# Altium schematic sheet FrontEnd.SchDoc
size B; SheetNumber: 3; SheetTotal: 5; SPICEModelCacheLCCOZNWX: <root> / <DocumentId>LCCOZNWX</DocumentId> / </root>
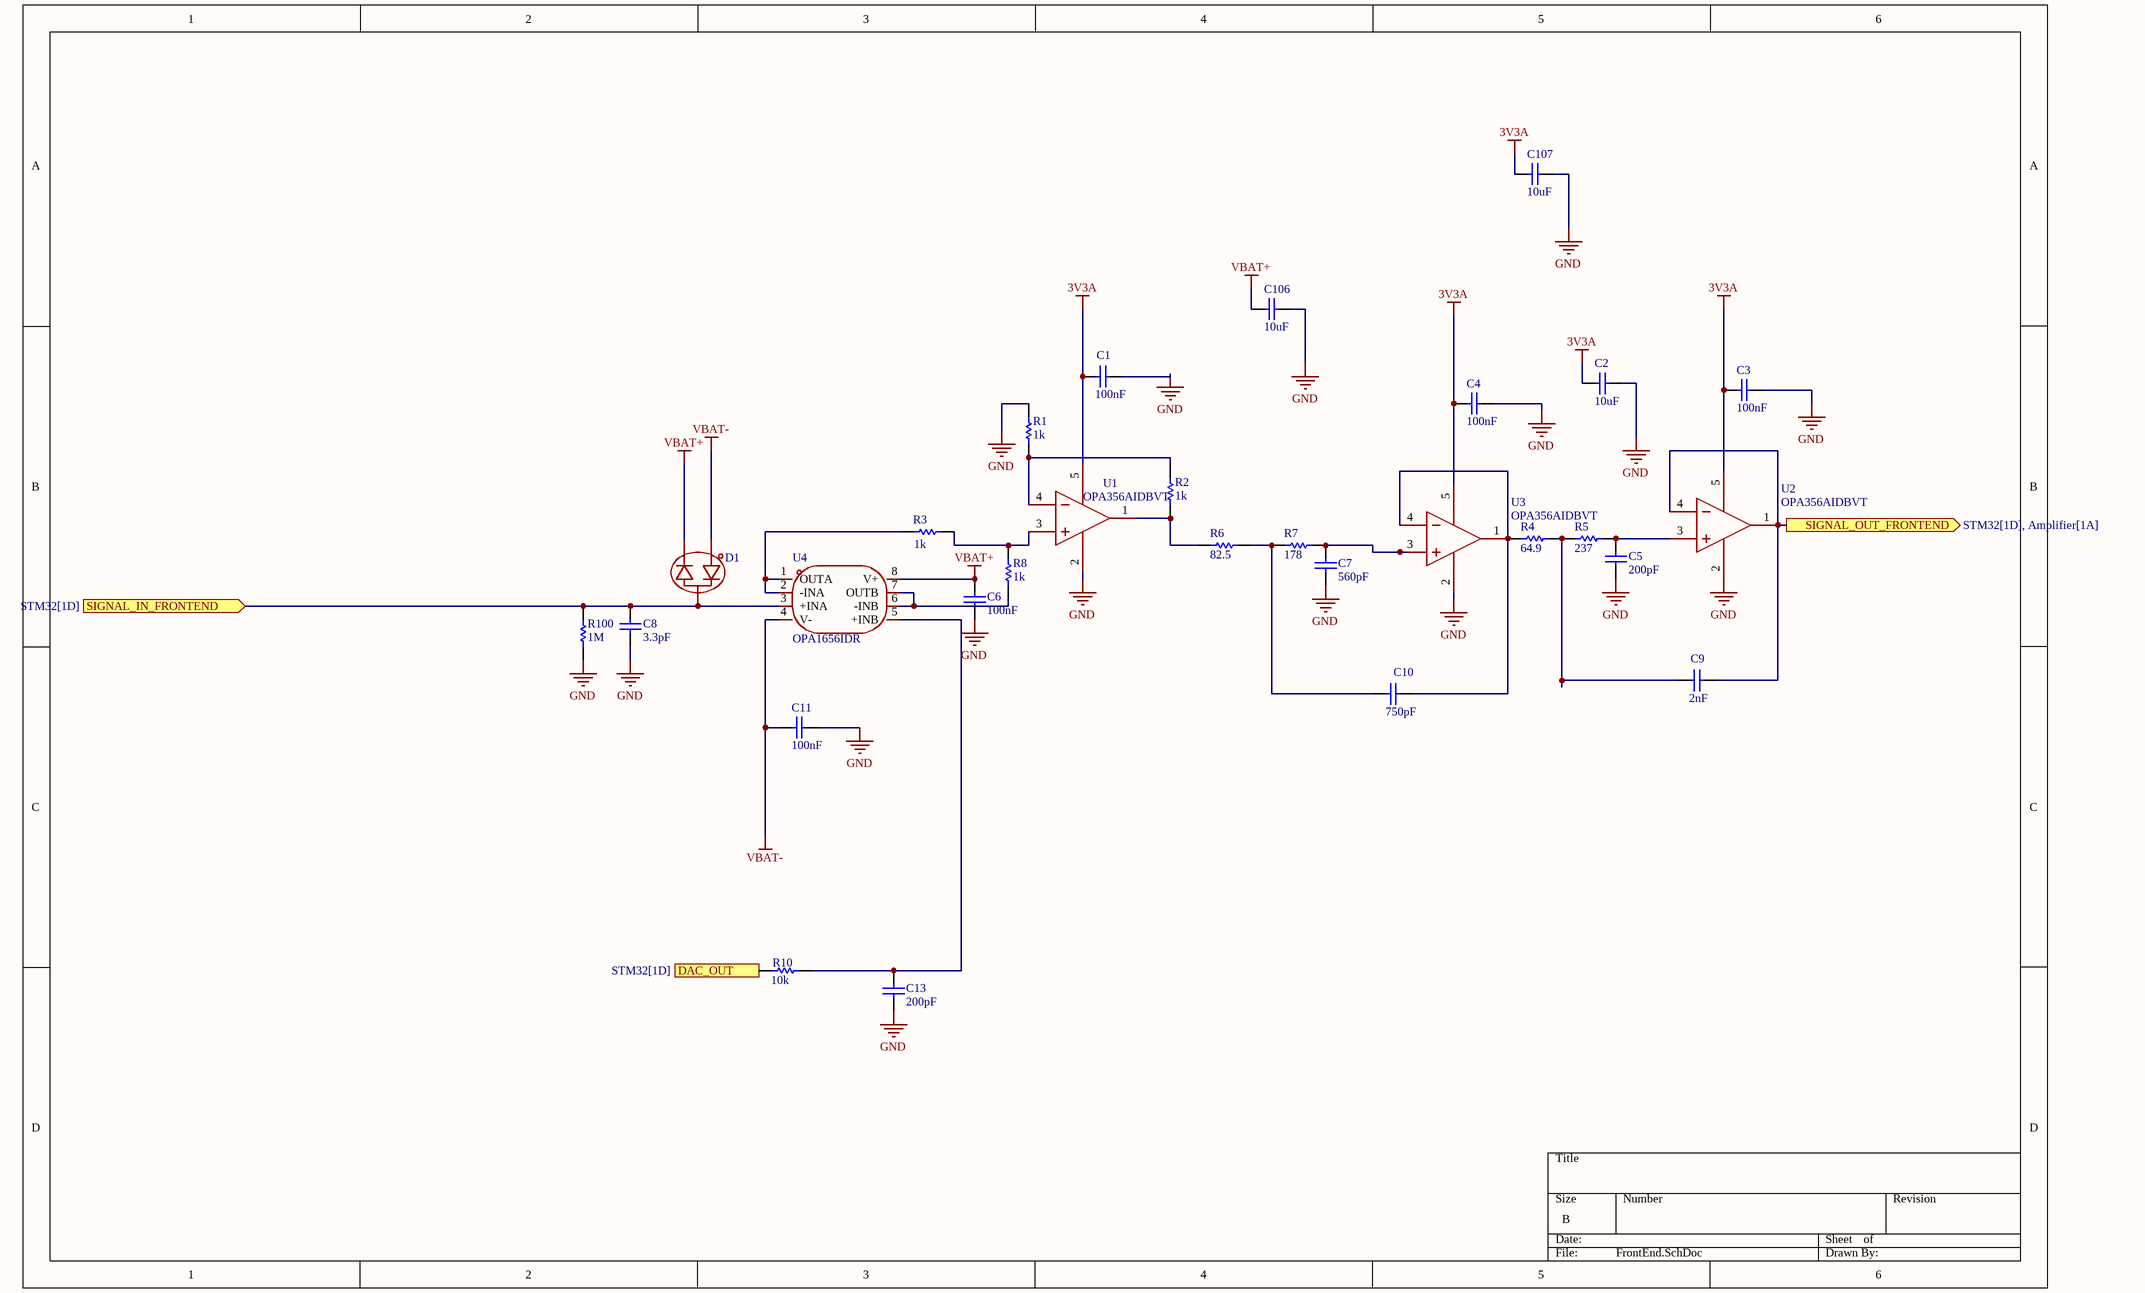
[diagram p0: FrontEnd.SchDoc]

## Parts
C1  value 100nF  [0603]  (hidden comment: Cap)
C2  value 10uF  [0603]  (hidden comment: Cap)
C3  value 100nF  [0603]  (hidden comment: Cap)
C4  value 100nF  [0603]  (hidden comment: Cap)
C5  value 200pF  [0603]  (hidden comment: Cap)
C6  value 100nF  [0603]  (hidden comment: Cap)
C7  value 560pF  [0603]  (hidden comment: Cap)
C8  value 3.3pF  [0603]  (hidden comment: Cap)
C9  value 2nF  [0603]  (hidden comment: Cap)
C10  value 750pF  [0603]  (hidden comment: Cap)
C11  value 100nF  [0603]  (hidden comment: Cap)
C13  value 200pF  [0603]  (hidden comment: Cap)
C106  value 10uF  [0603]  (hidden comment: Cap)
C107  value 10uF  [0603]  (hidden comment: Cap)
D1  YLED0805YG  [SOT-23-3]  (value not drawn)
R1  value 1k  [0603]  (hidden comment: Res1)
R2  value 1k  [0603]  (hidden comment: Res1)
R3  value 1k  [0603]  (hidden comment: Res1)
R4  value 64.9  [0603]  (hidden comment: Res1)
R5  value 237  [0603]  (hidden comment: Res1)
R6  value 82.5  [0603]  (hidden comment: Res1)
R7  value 178  [0603]  (hidden comment: Res1)
R8  value 1k  [0603]  (hidden comment: Res1)
R10  value 10k  [0603]  (hidden comment: Res1)
R100  value 1M  [0603]  (hidden comment: Res1)
U1  OPA356AIDBVT  [SOT-23-5]
U2  OPA356AIDBVT  [SOT-23-5]
U3  OPA356AIDBVT  [SOT-23-5]
U4  OPA1656IDR  [SOIC-8]

## Ports
DAC_OUT (in, see STM32[1D]), SIGNAL_IN_FRONTEND (in, see STM32[1D]), SIGNAL_OUT_FRONTEND (out, see STM32[1D], Amplifier[1A])

## Nets
3V3A: C1.1 C2.1 C3.1 C4.1 C107.1 U1.5(V+) U2.5(V+) U3.5(V+)
GND: C1.2 C2.2 C3.2 C4.2 C5.2 C6.1 C7.1 C8.1 C11.2 C13.1 C106.2 C107.2 R1.1 R100.1 U1.2(V-) U2.2(V-) U3.2(V-)
VBAT+: C6.2 C106.1 D1.2 U4.8(V+)
VBAT-: C11.1 D1.1 U4.4(V-)
DAC_OUT: R10.2 ; port DAC_OUT
SIGNAL_IN_FRONTEND: C8.2 D1.3 R100.2 U4.3(+INA) ; port SIGNAL_IN_FRONTEND
SIGNAL_OUT_FRONTEND: C9.1 U2.1(OUT) U2.4(IN-) ; port SIGNAL_OUT_FRONTEND
NetC5_1: C5.1 R5.1 U2.3(IN+)
NetC7_2: C7.2 R7.1 U3.3(IN+)
NetC9_2: C9.2 R4.1 R5.2
NetC10_1: C10.1 R4.2 U3.1(OUT) U3.4(IN-)
NetC10_2: C10.2 R6.1 R7.2
NetC13_2: C13.2 R10.1 U4.5(+INB)
NetR1_2: R1.2 R2.1 U1.4(IN-)
NetR2_2: R2.2 R6.2 U1.1(OUT)
NetR3_1: R3.1 U4.1(OUTA) U4.2(-INA)
NetR3_2: R3.2 R8.2 U1.3(IN+)
NetR8_1: R8.1 U4.6(-INB) U4.7(OUTB)

## Library data of the parts
C1-C11 C13 C106 C107 = Cap: Capacitor; Published: 8-Jun-2000; LatestRevisionDate: 17-Jul-2002; LatestRevisionNote: Re-released for DXP Platform.; PackageReference: RAD-0.3; Publisher: Altium Limited; PackageDescription: Radial Cap, Thru-Hole; 2 Leads; 0.3 in Pin Spacing
D1 = BAS7004E6327HTSA1: Dual Schottky diode, 70 V, 70 mA, SOT-23 package.
R1-R8 R10 R100 = Res1: Resistor; Published: 8-Jun-2000; LatestRevisionDate: 17-Jul-2002; LatestRevisionNote: Re-released for DXP Platform.; PackageReference: AXIAL-0.3; Publisher: Altium Limited; PackageDescription: Axial Device, Thru-Hole; 2 Leads; 0.3 in Pin Spacing
U1-U3 = OPA356AIDBVT: High-speed CMOS single operational amplifier, 200 MHz GBW, rail-to-rail output
U4 = OPA1656IDR: Dual FET-input audio op-amp, 2.9nV/√Hz, 53MHz GBW, SOIC-8